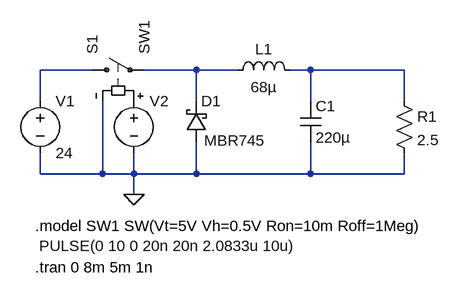
[diagram p0: schematic SIM-ANALOG-004.asc]
SIM-ANALOG-004.asc, the LTspice schematic file:
Version 4.1
SHEET 1 1228 680
WIRE 672 176 592 176
WIRE 832 176 752 176
WIRE 896 176 832 176
WIRE 1008 176 976 176
WIRE 1152 176 1008 176
WIRE 592 224 592 176
WIRE 832 224 832 176
WIRE 1008 224 1008 176
WIRE 1152 224 1152 176
WIRE 592 336 592 304
WIRE 688 336 688 224
WIRE 688 336 592 336
WIRE 736 336 736 304
WIRE 736 336 688 336
WIRE 832 336 832 288
WIRE 832 336 736 336
WIRE 1008 336 1008 288
WIRE 1008 336 832 336
WIRE 1152 336 1152 304
WIRE 1152 336 1008 336
WIRE 736 368 736 336
FLAG 736 368 0
SYMBOL res 1136 208 R0
SYMATTR InstName R1
SYMATTR Value 2.5
SYMBOL ind 880 192 R270
WINDOW 0 32 56 VTop 2
WINDOW 3 5 56 VBottom 2
SYMATTR InstName L1
SYMATTR Value 68µ
SYMATTR SpiceLine Rser=25m
SYMBOL cap 992 224 R0
SYMATTR InstName C1
SYMATTR Value 220µ
SYMATTR SpiceLine Rser=25m
SYMBOL voltage 592 208 R0
WINDOW 123 0 0 Left 0
WINDOW 39 0 0 Left 0
SYMATTR InstName V1
SYMATTR Value 24
SYMBOL voltage 736 208 R0
WINDOW 3 -146 239 Left 2
WINDOW 123 0 0 Left 0
WINDOW 39 0 0 Left 0
SYMATTR InstName V2
SYMATTR Value PULSE(0 10 0 20n 20n 2.0833u 10u)
SYMBOL sw 656 176 R270
SYMATTR InstName S1
SYMATTR Value SW1
SYMBOL schottky 848 288 R180
WINDOW 0 -22 64 Left 2
WINDOW 3 -90 3 Left 2
SYMATTR InstName D1
SYMATTR Value MBR745
TEXT 584 480 Left 2 !.tran 0 8m 5m 1n
TEXT 584 416 Left 2 !.model SW1 SW(Vt=5V Vh=0.5V Ron=10m Roff=1Meg)

The netlist it stands for:
* SIM-ANALOG-004.asc
R1 N003 0 2.5
L1 N002 N003 68µ Rser=25m
C1 N003 0 220µ Rser=25m
V1 N001 0 24
V2 P001 0 PULSE(0 10 0 20n 20n 2.0833u 10u)
S1 N001 N002 P001 0 SW1
D1 0 N002 MBR745
.model D D
.lib standard.dio
.tran 0 8m 5m 1n
.model SW1 SW(Vt=5V Vh=0.5V Ron=10m Roff=1Meg)
.backanno
.end